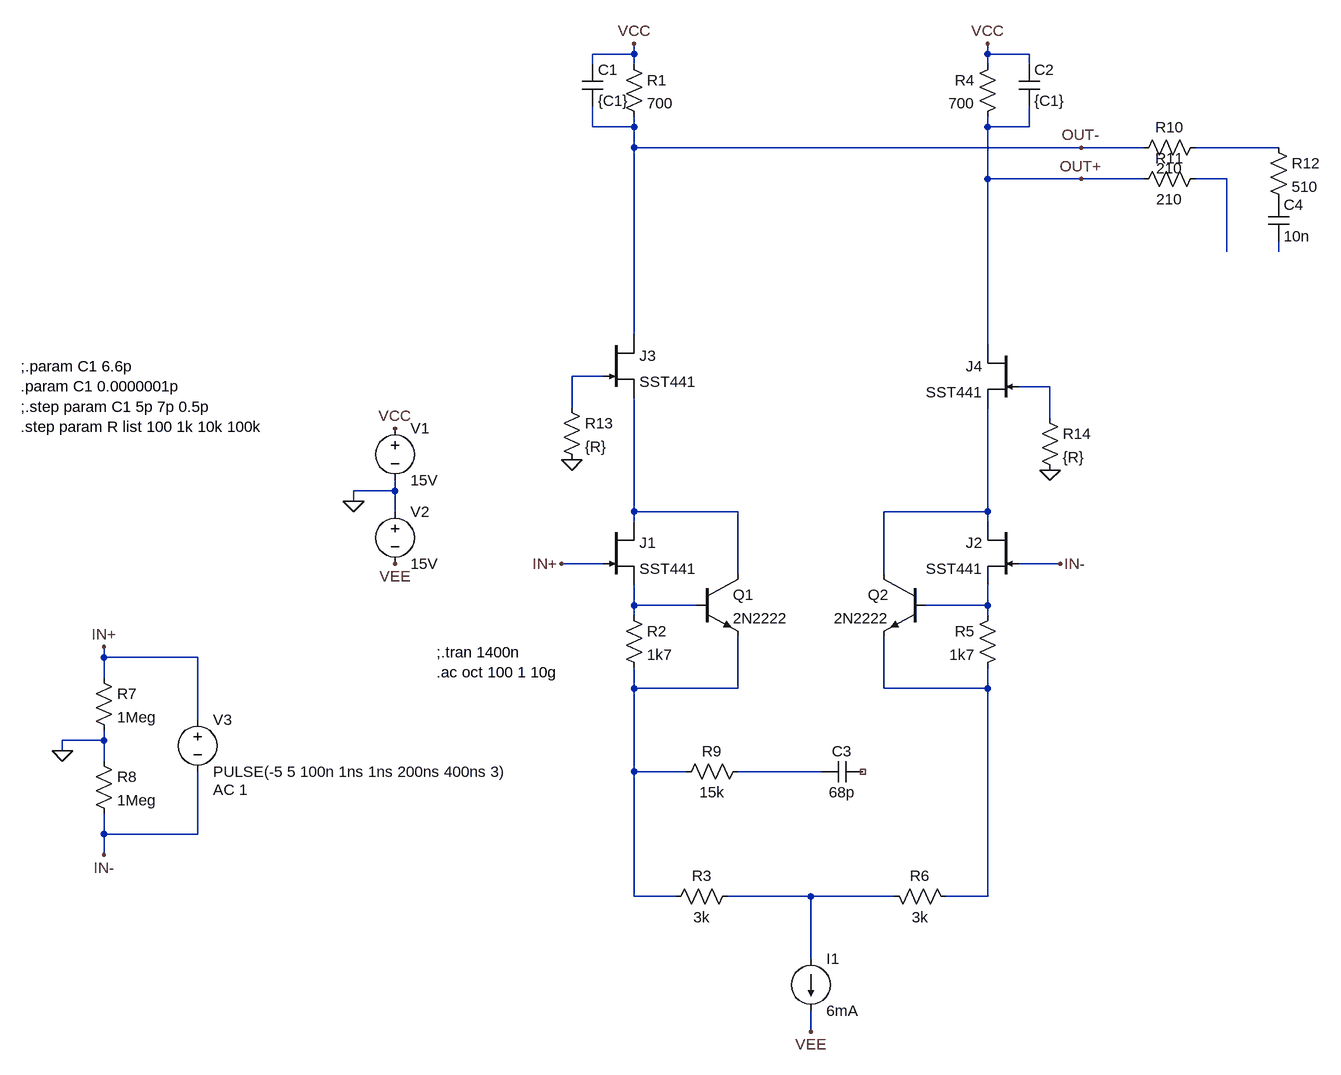
[diagram p0: schematic long_tailed_pair_cascode.asc]
long_tailed_pair_cascode.asc, the LTspice schematic file:
Version 4
SHEET 1 1268 944
WIRE 176 -672 176 -688
WIRE 176 -672 112 -672
WIRE 720 -672 720 -688
WIRE 784 -672 720 -672
WIRE 112 -656 112 -672
WIRE 176 -656 176 -672
WIRE 720 -656 720 -672
WIRE 784 -656 784 -672
WIRE 112 -560 112 -592
WIRE 176 -560 176 -576
WIRE 176 -560 112 -560
WIRE 720 -560 720 -576
WIRE 784 -560 784 -592
WIRE 784 -560 720 -560
WIRE 176 -528 176 -560
WIRE 864 -528 176 -528
WIRE 960 -528 864 -528
WIRE 1168 -528 1040 -528
WIRE 720 -480 720 -560
WIRE 864 -480 720 -480
WIRE 960 -480 864 -480
WIRE 1088 -480 1040 -480
WIRE 1088 -368 1088 -480
WIRE 1168 -368 1168 -384
WIRE 176 -240 176 -528
WIRE 720 -224 720 -480
WIRE 128 -176 80 -176
WIRE 816 -160 768 -160
WIRE 80 -128 80 -176
WIRE 816 -112 816 -160
WIRE -192 0 -192 -16
WIRE -192 0 -256 0
WIRE -256 16 -256 0
WIRE -192 32 -192 0
WIRE 176 32 176 -144
WIRE 336 32 176 32
WIRE 720 32 720 -128
WIRE 720 32 560 32
WIRE 176 48 176 32
WIRE 720 48 720 32
WIRE 128 112 64 112
WIRE 832 112 768 112
WIRE 336 128 336 32
WIRE 560 128 560 32
WIRE 176 176 176 144
WIRE 272 176 176 176
WIRE 720 176 720 144
WIRE 720 176 624 176
WIRE 176 192 176 176
WIRE 720 192 720 176
WIRE -640 256 -640 240
WIRE -496 256 -640 256
WIRE -640 288 -640 256
WIRE 176 304 176 272
WIRE 336 304 336 224
WIRE 336 304 176 304
WIRE 560 304 560 224
WIRE 720 304 720 272
WIRE 720 304 560 304
WIRE -496 352 -496 256
WIRE -640 384 -640 368
WIRE -640 384 -704 384
WIRE -704 400 -704 384
WIRE -640 416 -640 384
WIRE 176 432 176 304
WIRE 256 432 176 432
WIRE 464 432 336 432
WIRE -640 528 -640 496
WIRE -496 528 -496 432
WIRE -496 528 -640 528
WIRE -640 560 -640 528
WIRE 176 624 176 432
WIRE 240 624 176 624
WIRE 448 624 320 624
WIRE 576 624 448 624
WIRE 720 624 720 304
WIRE 720 624 656 624
WIRE 448 720 448 624
WIRE 448 832 448 800
FLAG -256 16 0
FLAG -192 -96 VCC
FLAG -192 112 VEE
FLAG 176 -688 VCC
FLAG 448 832 VEE
FLAG 64 112 IN+
FLAG 720 -688 VCC
FLAG 832 112 IN-
FLAG -640 240 IN+
FLAG -704 400 0
FLAG 864 -480 OUT+
FLAG 864 -528 OUT-
FLAG -640 560 IN-
FLAG 80 -48 0
FLAG 816 -32 0
SYMBOL njf 128 48 R0
SYMATTR InstName J1
SYMATTR Value SST441
SYMBOL res 160 -672 R0
SYMATTR InstName R1
SYMATTR Value 700
SYMBOL res 160 176 R0
SYMATTR InstName R2
SYMATTR Value 1k7
SYMBOL res 224 640 R270
WINDOW 0 32 56 VTop 2
WINDOW 3 0 56 VBottom 2
SYMATTR InstName R3
SYMATTR Value 3k
SYMBOL current 448 720 R0
WINDOW 123 0 0 Left 0
WINDOW 39 0 0 Left 0
SYMATTR InstName I1
SYMATTR Value 6mA
SYMBOL voltage -192 -112 R0
WINDOW 123 0 0 Left 0
WINDOW 39 0 0 Left 0
SYMATTR InstName V1
SYMATTR Value 15V
SYMBOL voltage -192 16 R0
WINDOW 123 0 0 Left 0
WINDOW 39 0 0 Left 0
SYMATTR InstName V2
SYMATTR Value 15V
SYMBOL npn 272 128 R0
SYMATTR InstName Q1
SYMATTR Value 2N2222
SYMBOL njf 768 48 M0
SYMATTR InstName J2
SYMATTR Value SST441
SYMBOL res 736 -672 M0
SYMATTR InstName R4
SYMATTR Value 700
SYMBOL res 736 176 M0
SYMATTR InstName R5
SYMATTR Value 1k7
SYMBOL res 672 640 M270
WINDOW 0 32 56 VTop 2
WINDOW 3 0 56 VBottom 2
SYMATTR InstName R6
SYMATTR Value 3k
SYMBOL npn 624 128 M0
SYMATTR InstName Q2
SYMATTR Value 2N2222
SYMBOL voltage -496 336 R0
WINDOW 123 24 124 Left 2
WINDOW 39 0 0 Left 0
SYMATTR Value2 AC 1
SYMATTR InstName V3
SYMATTR Value PULSE(-5 5 100n 1ns 1ns 200ns 400ns 3)
SYMBOL cap 96 -656 R0
SYMATTR InstName C1
SYMATTR Value {C1}
SYMBOL cap 768 -656 R0
SYMATTR InstName C2
SYMATTR Value {C1}
SYMBOL res -656 272 R0
SYMATTR InstName R7
SYMATTR Value 1Meg
SYMBOL res -656 400 R0
SYMATTR InstName R8
SYMATTR Value 1Meg
SYMBOL res 352 416 R90
WINDOW 0 0 56 VBottom 2
WINDOW 3 32 56 VTop 2
SYMATTR InstName R9
SYMATTR Value 15k
SYMBOL cap 528 416 R90
WINDOW 0 0 32 VBottom 2
WINDOW 3 32 32 VTop 2
SYMATTR InstName C3
SYMATTR Value 68p
SYMBOL res 1056 -544 R90
WINDOW 0 0 56 VBottom 2
WINDOW 3 32 56 VTop 2
SYMATTR InstName R10
SYMATTR Value 210
SYMBOL res 1056 -496 R90
WINDOW 0 0 56 VBottom 2
WINDOW 3 32 56 VTop 2
SYMATTR InstName R11
SYMATTR Value 210
SYMBOL res 1152 -544 R0
SYMATTR InstName R12
SYMATTR Value 510
SYMBOL cap 1152 -448 R0
SYMATTR InstName C4
SYMATTR Value 10n
SYMBOL njf 128 -240 R0
SYMATTR InstName J3
SYMATTR Value SST441
SYMBOL njf 768 -224 M0
SYMATTR InstName J4
SYMATTR Value SST441
SYMBOL res 64 -144 R0
SYMATTR InstName R13
SYMATTR Value {R}
SYMBOL res 800 -128 R0
SYMATTR InstName R14
SYMATTR Value {R}
TEXT -128 248 Left 2 !;.tran 1400n\n.ac oct 100 1 10g
TEXT -768 -192 Left 2 !;.param C1 6.6p\n.param C1 0.0000001p\n;.step param C1 5p 7p 0.5p\n.step param R list 100 1k 10k 100k

The netlist it stands for:
* long_tailed_pair_cascode.asc
J1 N006 IN+ N008 SST441
R1 VCC OUT- 700
R2 N008 N010 1k7
R3 N010 N013 3k
I1 N013 VEE 6mA
V1 VCC 0 15V
V2 0 VEE 15V
Q1 N006 N008 N010 0 2N2222
J2 N007 IN- N009 SST441
R4 VCC OUT+ 700
R5 N009 N011 1k7
R6 N011 N013 3k
Q2 N007 N009 N011 0 2N2222
V3 IN+ IN- PULSE(-5 5 100n 1ns 1ns 200ns 400ns 3) AC 1
C1 VCC OUT- {C1}
C2 VCC OUT+ {C1}
R7 IN+ 0 1Meg
R8 0 IN- 1Meg
R9 N012 N010 15k
C3 NC_01 N012 68p
R10 N001 OUT- 210
R11 N002 OUT+ 210
R12 N001 P001 510
C4 P001 N003 10n
J3 OUT- N004 N006 SST441
J4 OUT+ N005 N007 SST441
R13 N004 0 {R}
R14 N005 0 {R}
.model NPN NPN
.model PNP PNP
.lib standard.bjt
.model NJF NJF
.model PJF PJF
.lib standard.jft
;.tran 1400n
.ac oct 100 1 10g
;.param C1 6.6p
.param C1 0.0000001p
;.step param C1 5p 7p 0.5p
.step param R list 100 1k 10k 100k
.backanno
.end